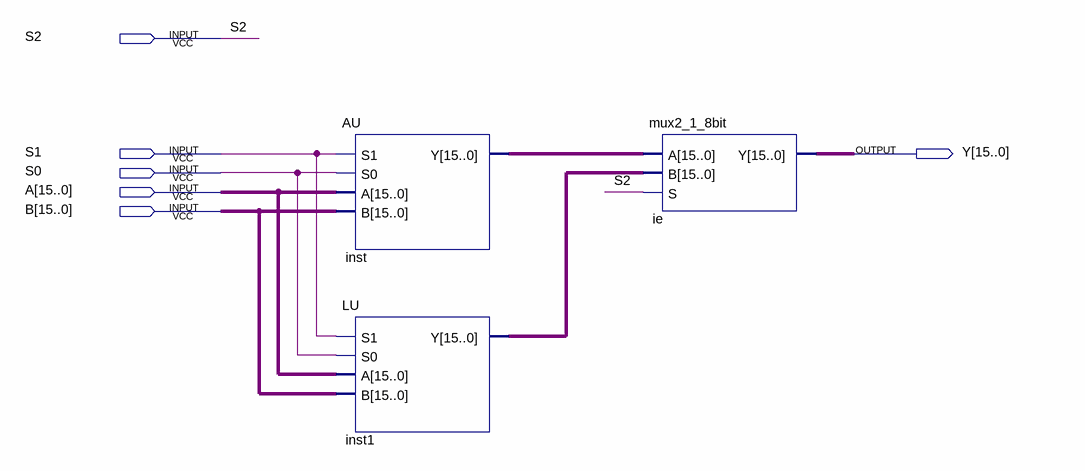
[diagram p0: schematic sheet]
// Quartus schematic ALU.bdf as structural Verilog: 3 symbols, 6 pins
module ALU (
  input  S2,
  input  S1,
  input  S0,
  input  [15:0] A,
  input  [15:0] B,
  output [15:0] Y
);

  wire [15:0] inst1_y, inst_y;

  AU inst (.S1(S1), .S0(S0), .A(A), .B(B), .Y(inst_y));
  LU inst1 (.S1(S1), .S0(S0), .A(A), .B(B), .Y(inst1_y));
  mux2_1_8bit ie (.A(inst_y), .B(inst1_y), .S(S2), .Y(Y));
endmodule
